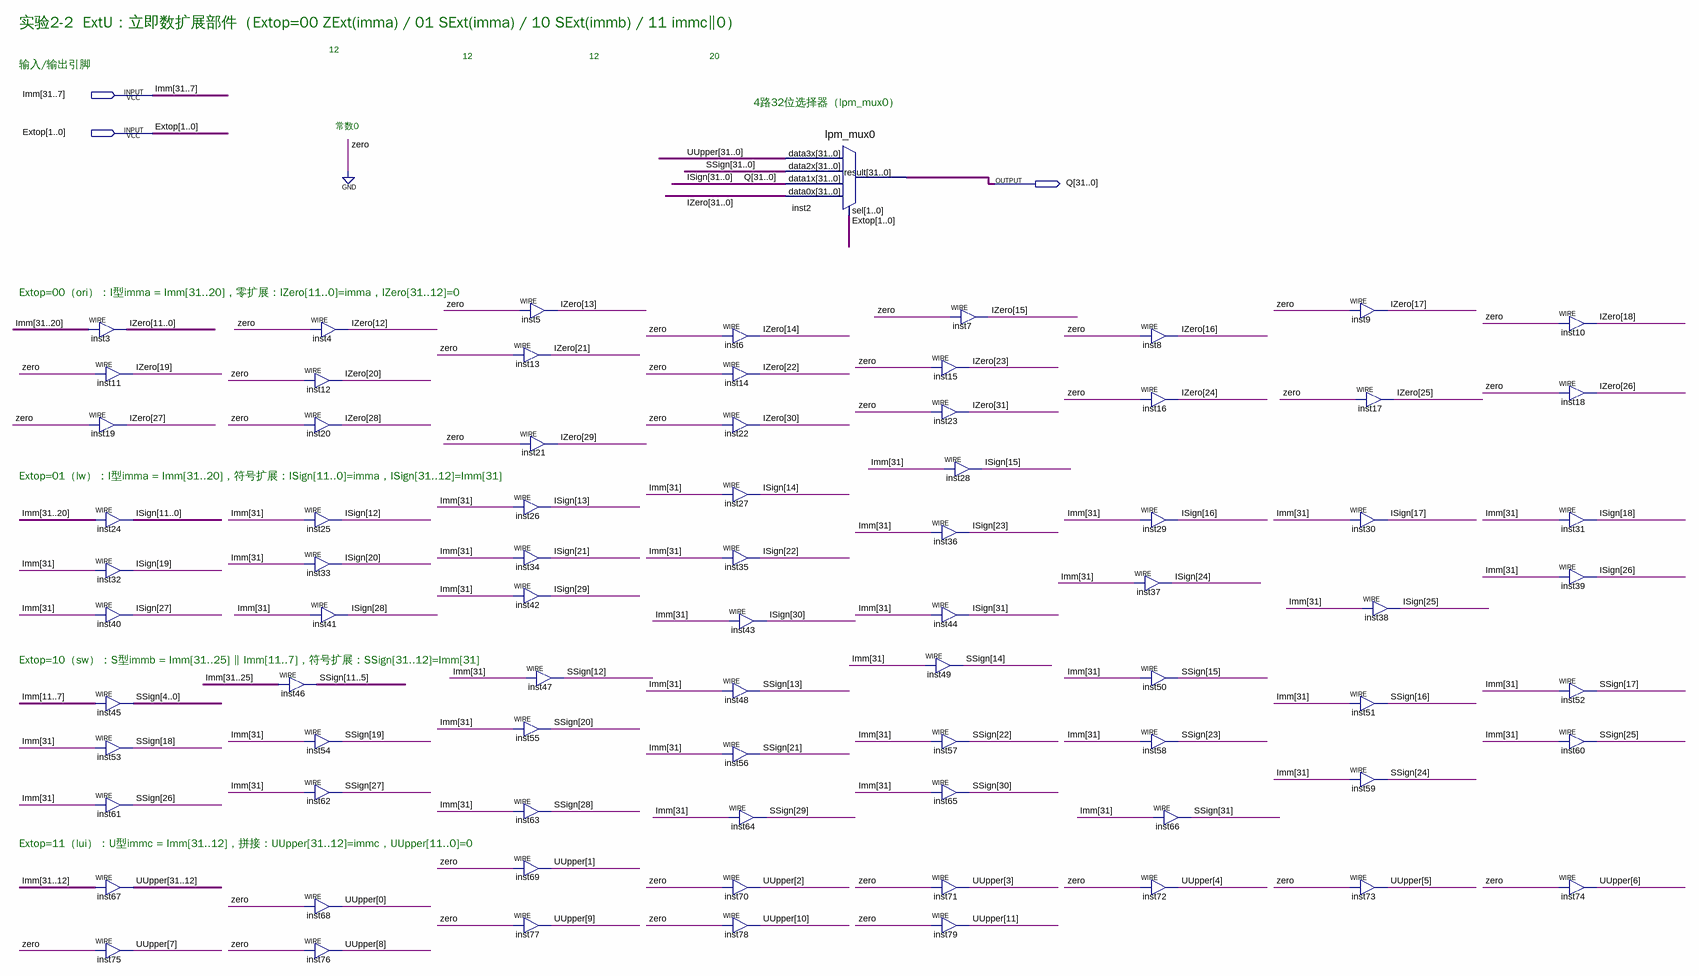
[diagram p0: schematic sheet]
// Quartus schematic ExtU.bdf as structural Verilog: 78 symbols, 3 pins
module ExtU (
  input  [31:7] Imm,
  input  [1:0] Extop,
  output [31:0] Q
);

  wire [31:0] ISign, IZero, SSign, UUpper;

  assign IZero[11:0] = Imm[31:20];  // WIRE inst3
  assign IZero[19] = 1'b0;  // WIRE inst11
  assign IZero[27] = 1'b0;  // WIRE inst19
  assign ISign[11:0] = Imm[31:20];  // WIRE inst24
  assign ISign[19] = Imm[31];  // WIRE inst32
  assign ISign[27] = Imm[31];  // WIRE inst40
  assign SSign[4:0] = Imm[11:7];  // WIRE inst45
  assign SSign[18] = Imm[31];  // WIRE inst53
  assign SSign[26] = Imm[31];  // WIRE inst61
  assign UUpper[31:12] = Imm[31:12];  // WIRE inst67
  assign UUpper[7] = 1'b0;  // WIRE inst75
  assign IZero[12] = 1'b0;  // WIRE inst4
  assign IZero[20] = 1'b0;  // WIRE inst12
  assign IZero[28] = 1'b0;  // WIRE inst20
  assign ISign[12] = Imm[31];  // WIRE inst25
  assign ISign[20] = Imm[31];  // WIRE inst33
  assign ISign[28] = Imm[31];  // WIRE inst41
  assign SSign[11:5] = Imm[31:25];  // WIRE inst46
  assign SSign[19] = Imm[31];  // WIRE inst54
  assign SSign[27] = Imm[31];  // WIRE inst62
  assign UUpper[0] = 1'b0;  // WIRE inst68
  assign UUpper[8] = 1'b0;  // WIRE inst76
  assign IZero[13] = 1'b0;  // WIRE inst5
  assign IZero[21] = 1'b0;  // WIRE inst13
  assign IZero[29] = 1'b0;  // WIRE inst21
  assign ISign[13] = Imm[31];  // WIRE inst26
  assign ISign[21] = Imm[31];  // WIRE inst34
  assign ISign[29] = Imm[31];  // WIRE inst42
  assign SSign[20] = Imm[31];  // WIRE inst55
  assign SSign[28] = Imm[31];  // WIRE inst63
  assign UUpper[1] = 1'b0;  // WIRE inst69
  assign UUpper[9] = 1'b0;  // WIRE inst77
  assign SSign[12] = Imm[31];  // WIRE inst47
  assign IZero[14] = 1'b0;  // WIRE inst6
  assign IZero[22] = 1'b0;  // WIRE inst14
  assign IZero[30] = 1'b0;  // WIRE inst22
  assign ISign[14] = Imm[31];  // WIRE inst27
  assign ISign[22] = Imm[31];  // WIRE inst35
  assign SSign[13] = Imm[31];  // WIRE inst48
  assign SSign[21] = Imm[31];  // WIRE inst56
  assign UUpper[2] = 1'b0;  // WIRE inst70
  assign UUpper[10] = 1'b0;  // WIRE inst78
  assign ISign[30] = Imm[31];  // WIRE inst43
  assign SSign[29] = Imm[31];  // WIRE inst64
  lpm_mux0 inst2 (.data3x(UUpper), .data2x(SSign), .data1x(ISign), .data0x(IZero), .sel(Extop), .result(Q));
  assign SSign[14] = Imm[31];  // WIRE inst49
  assign IZero[15] = 1'b0;  // WIRE inst7
  assign IZero[23] = 1'b0;  // WIRE inst15
  assign IZero[31] = 1'b0;  // WIRE inst23
  assign ISign[15] = Imm[31];  // WIRE inst28
  assign ISign[23] = Imm[31];  // WIRE inst36
  assign ISign[31] = Imm[31];  // WIRE inst44
  assign SSign[22] = Imm[31];  // WIRE inst57
  assign SSign[30] = Imm[31];  // WIRE inst65
  assign UUpper[3] = 1'b0;  // WIRE inst71
  assign UUpper[11] = 1'b0;  // WIRE inst79
  assign IZero[16] = 1'b0;  // WIRE inst8
  assign IZero[24] = 1'b0;  // WIRE inst16
  assign ISign[16] = Imm[31];  // WIRE inst29
  assign ISign[24] = Imm[31];  // WIRE inst37
  assign SSign[15] = Imm[31];  // WIRE inst50
  assign SSign[23] = Imm[31];  // WIRE inst58
  assign SSign[31] = Imm[31];  // WIRE inst66
  assign UUpper[4] = 1'b0;  // WIRE inst72
  assign IZero[17] = 1'b0;  // WIRE inst9
  assign IZero[25] = 1'b0;  // WIRE inst17
  assign ISign[17] = Imm[31];  // WIRE inst30
  assign ISign[25] = Imm[31];  // WIRE inst38
  assign SSign[16] = Imm[31];  // WIRE inst51
  assign SSign[24] = Imm[31];  // WIRE inst59
  assign UUpper[5] = 1'b0;  // WIRE inst73
  assign IZero[18] = 1'b0;  // WIRE inst10
  assign IZero[26] = 1'b0;  // WIRE inst18
  assign ISign[18] = Imm[31];  // WIRE inst31
  assign ISign[26] = Imm[31];  // WIRE inst39
  assign SSign[17] = Imm[31];  // WIRE inst52
  assign SSign[25] = Imm[31];  // WIRE inst60
  assign UUpper[6] = 1'b0;  // WIRE inst74

  // Notes on the sheet:
  //   实验2-2  ExtU：立即数扩展部件（Extop=00 ZExt(imma) / 01 SExt(imma) / 10 SExt(immb) / 11 immc‖0）
  //   12
  //   12
  //   12
  //   20
  //   输入/输出引脚
  //   4路32位选择器（lpm_mux0）
  //   常数0
  //   Extop=00（ori）：I型imma = Imm[31..20]，零扩展：IZero[11..0]=imma，IZero[31..12]=0
  //   Extop=01（lw）：I型imma = Imm[31..20]，符号扩展：ISign[11..0]=imma，ISign[31..12]=Imm[31]
  //   Extop=10（sw）：S型immb = Imm[31..25] ‖ Imm[11..7]，符号扩展：SSign[31..12]=Imm[31]
  //   Extop=11（lui）：U型immc = Imm[31..12]，拼接：UUpper[31..12]=immc，UUpper[11..0]=0
endmodule
